# Altium schematic sheet Sheet1.SchDoc
size B; SheetNumber: 1; SheetTotal: 2
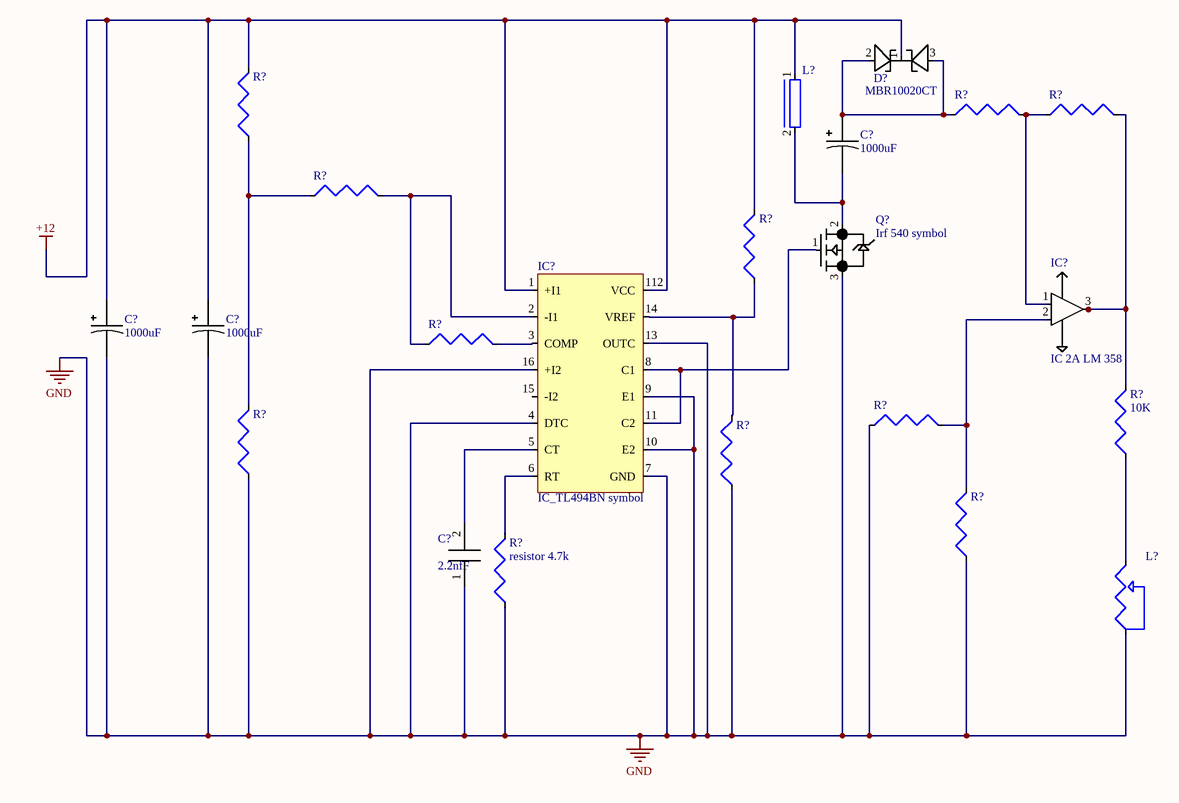
[diagram p0: Sheet1.SchDoc]

## Parts
(Parts that share a designator on the sheet are numbered #1, #2 ... from top to bottom, then left to right.)
C?#1  1000uF  [capacitor]
C?#2  1000uF  [capacitor]
C?#3  1000uF  [capacitor]
C?#4  value 2.2nfF  [capacitor]  (hidden comment: capacitor symbol)
D?  MBR10020CT  [IRF 540 through hole]
IC?#1  IC 2A LM 358  [IC-2A-LM358]
IC?#2  IC_TL494BN symbol  [TL494BN]
L?#1  L1  [capacitor]  (value not drawn)
L?#2  potentiomater  [Resistor]  (value not drawn)
Q?  Irf 540 symbol  [IRF 540 through hole]
R?#1  Resistor 1206  [Resistor]  (value not drawn)
R?#2  Resistor 1206  [Resistor]  (value not drawn)
R?#3  Resistor 1206  [Resistor]  (value not drawn)
R?#4  Resistor 1206  [Resistor]  (value not drawn)
R?#5  Resistor 1206  [Resistor]  (value not drawn)
R?#6  Resistor 1206  [Resistor]  (value not drawn)
R?#7  Resistor 1206  [Resistor]  (value not drawn)
R?#8  10K  [Resistor]
R?#9  Resistor 1206  [Resistor]  (value not drawn)
R?#10  Resistor 1206  [Resistor]  (value not drawn)
R?#11  Resistor 1206  [Resistor]  (value not drawn)
R?#12  resistor 4.7k  [Resistor]

## Nets
+12: C?#2.1 C?#3.1 D?.1 IC?#2.1(+I1) IC?#2.112(VCC) L?#1.1 R?#3.2 R?#5.2
GND: C?#2.2 C?#3.2 C?#4.1 IC?#2.4(DTC) IC?#2.7(GND) IC?#2.9(E1) IC?#2.10(E2) IC?#2.13(OUTC) IC?#2.16(+I2) L?#2.1 Q?.3 R?#7.1 R?#9.1 R?#10.1 R?#11.1 R?#12.1(cathode)
NetC?#1_1: C?#1.1 D?.2 D?.3 R?#1.1
NetC?#1_2: C?#1.2 L?#1.2 Q?.2
NetC?#4_2: C?#4.2 IC?#2.5(CT)
NetIC?#1_1: IC?#1.1 R?#1.2 R?#2.1
NetIC?#1_2: IC?#1.2 R?#7.2 R?#11.2
NetIC?#1_3: IC?#1.3 R?#2.2 R?#8.2
NetIC?#2_2: IC?#2.2(-I1) R?#4.2 R?#6.1
NetIC?#2_3: IC?#2.3(COMP) R?#6.2
NetIC?#2_6: IC?#2.6(RT) R?#12.2(anode)
NetIC?#2_8: IC?#2.8(C1) IC?#2.11(C2) Q?.1
NetIC?#2_14: IC?#2.14(VREF) R?#5.1 R?#10.2
NetL?#2_2: L?#2.2 R?#8.1
NetR?#3_1: R?#3.1 R?#4.1 R?#9.2

Not connected (* = marked no-connect by the designer): IC?#2 15(-I2)

## Library data of the parts
L?#1 = inductor
R?#8 = Resistor 1206